# Altium schematic sheet pcb up.SchDoc
size A2
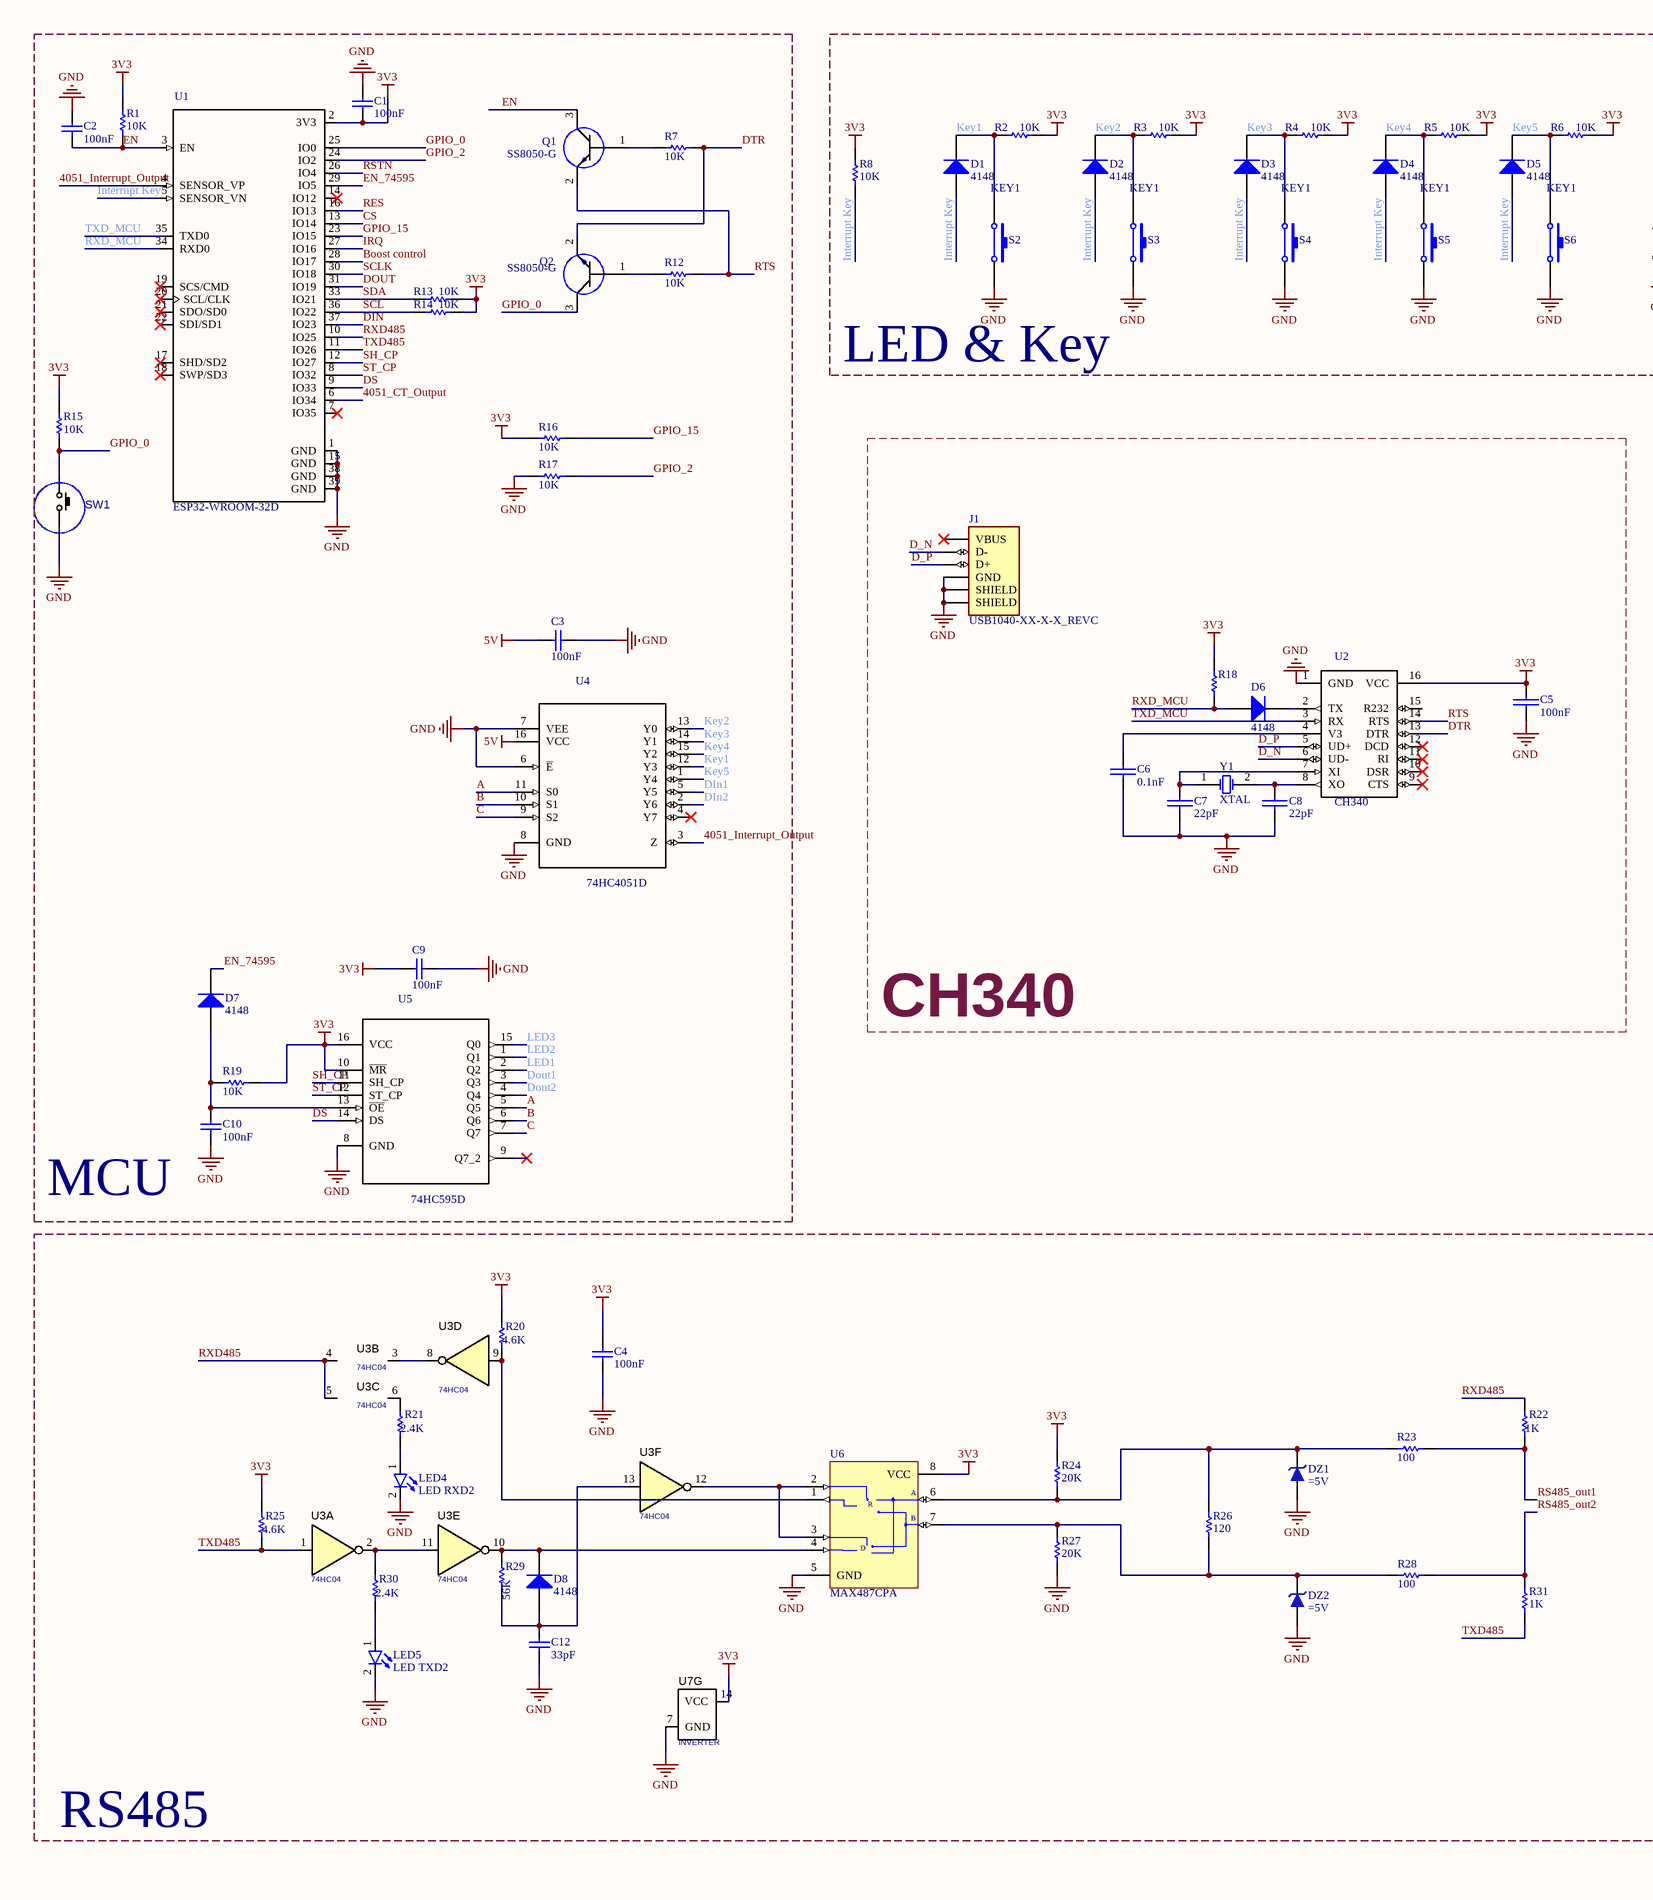
[diagram p0: pcb up.SchDoc, left]
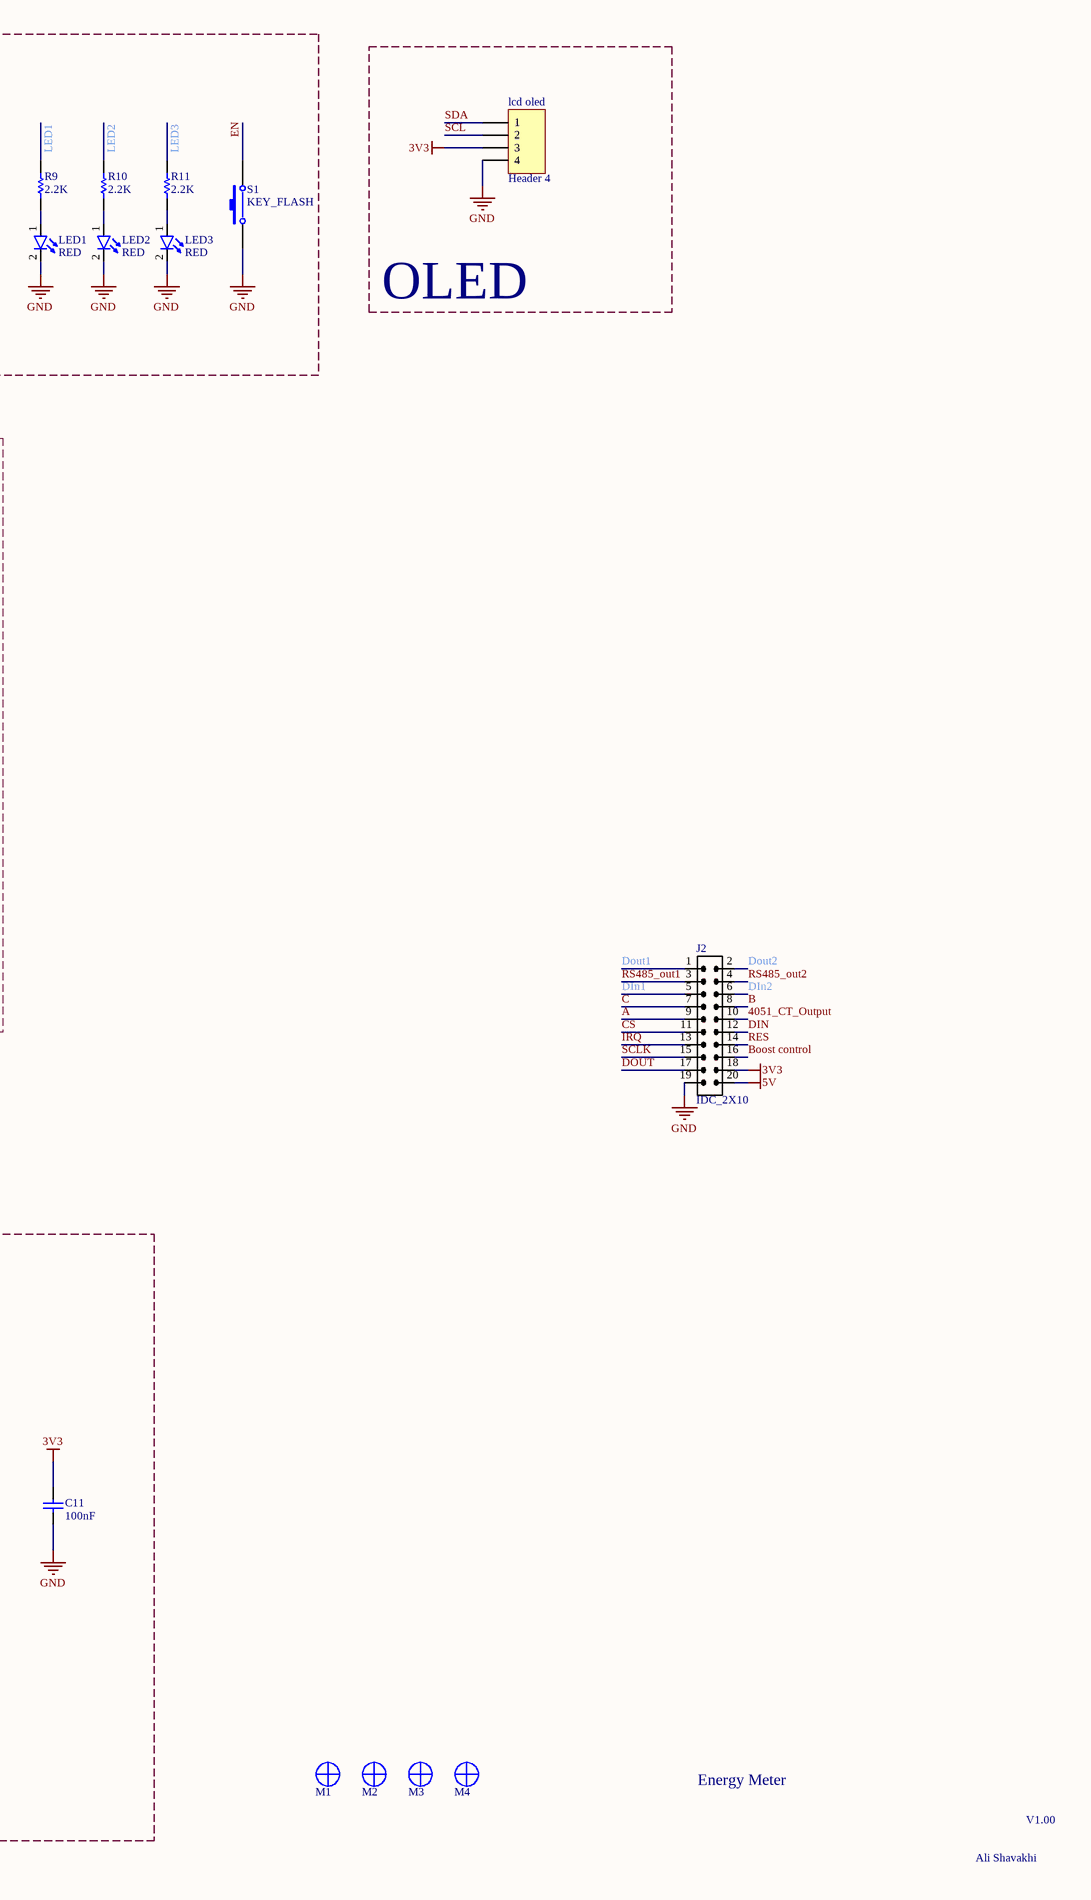
[diagram p1: pcb up.SchDoc, right]

## Parts
C1  100nF  [CAP805]
C2  100nF  [CAP805]
C3  100nF  [CAP805]
C4  100nF  [CAP805]
C5  100nF  [CAP805]
C6  0.1nF  [CAP805]
C7  22pF  [CAP805]
C8  22pF  [CAP805]
C9  100nF  [CAP805]
C10  100nF  [CAP805]
C11  100nF  [CAP805]
C12  33pF  [CAP805]
D1  4148  [Diode 1n4148 SMD]
D2  4148  [Diode 1n4148 SMD]
D3  4148  [Diode 1n4148 SMD]
D4  4148  [Diode 1n4148 SMD]
D5  4148  [Diode 1n4148 SMD]
D6  4148  [Diode 1n4148 SMD]
D7  4148  [Diode 1n4148 SMD]
D8  4148  [Diode 1n4148 SMD]
DZ1  (no value)  [SOD80, LL-34]
DZ2  (no value)  [SOD80, LL-34]
J1  USB1040-XX-X-X_REVC  [GCT_USB1040-XX-X-X_REVC]
J2  IDC_2X10  [IDC_2X10]
lcd_oled  Header 4  [HDR1X4]
LED1  RED  [LED3mm_GRN]
LED2  RED  [LED3mm_GRN]
LED3  RED  [LED3mm_GRN]
LED4  LED RXD2  [LED_SMD_0805]
LED5  LED TXD2  [LED_SMD_0805]
M1  Screw  [Board Screw]  (value not drawn)
M2  Screw  [Board Screw]  (value not drawn)
M3  Screw  [Board Screw]  (value not drawn)
M4  Screw  [Board Screw]  (value not drawn)
Q1  SS8050-G  [SOT23_BEC_M]
Q2  SS8050-G  [SOT23_BEC_M]
R1  10K  [RES0805_(2012X06L)]
R2  10K  [RES0805_(2012X06L)]
R3  10K  [RES0805_(2012X06L)]
R4  10K  [RES0805_(2012X06L)]
R5  10K  [RES0805_(2012X06L)]
R6  10K  [RES0805_(2012X06L)]
R7  10K  [RES0805_(2012X06L)]
R8  10K  [RES0805_(2012X06L)]
R9  2.2K  [RES0805_(2012X06L)]
R10  2.2K  [RES0805_(2012X06L)]
R11  2.2K  [RES0805_(2012X06L)]
R12  10K  [RES0805_(2012X06L)]
R13  10K  [RES0805_(2012X06L)]
R14  10K  [RES0805_(2012X06L)]
R15  10K  [RES0805_(2012X06L)]
R16  10K  [RES0805_(2012X06L)]
R17  10K  [RES0805_(2012X06L)]
R18  (no value)  [RES0805_(2012X06L)]
R19  10K  [RES0805_(2012X06L)]
R20  4.6K  [RES0805_(2012X06L)]
R21  2.4K  [RES0805_(2012X06L)]
R22  1K  [RES0805_(2012X06L)]
R23  100  [RES0805_(2012X06L)]
R24  20K  [RES0805_(2012X06L)]
R25  4.6K  [RES0805_(2012X06L)]
R26  120  [RES0805_(2012X06L)]
R27  20K  [RES0805_(2012X06L)]
R28  100  [RES0805_(2012X06L)]
R29  56K  [RES0805_(2012X06L)]
R30  2.4K  [RES0805_(2012X06L)]
R31  1K  [RES0805_(2012X06L)]
S1  KEY_FLASH  [SW-PB]
S2  KEY1  [SW-PB]
S3  KEY1  [SW-PB]
S4  KEY1  [SW-PB]
S5  KEY1  [SW-PB]
S6  KEY1  [SW-PB]
SW1  PUSHBUTTON  [SWPBS_SPST_6X3X5]  (value not drawn)
U1  ESP32-WROOM-32D  [ESP32_WROOM]
U2  CH340  [SO016]
U3  74HC04  [SOIC127P600X175-14N]  (parts A,B,C,D,E,F of 7)
U4  74HC4051D  [SOIC127P600X175-16N]
U5  74HC595D  [SOIC127P600X175-16N]
U6  MAX487CPA  [SO_8]
U7  INVERTER  [SOIC127P600X175-14N]  (part G of 7)
Y1  XTAL  [Crystal SMD]

## Nets
3V3: C1.1 C4.1 C5.2(-) C9.1 C11.1 J2.18 lcd_oled.3 R1.2 R2.1 R3.1 R4.1 R5.1 R6.1 R8.2 R13.1 R14.2 R15.2 R16.2 R18.1 R19.1 R20.1 R24.2 R25.1 U1.2(3V3) U2.16(VCC) U5.10(~{MR}) U5.16(VCC) U6.8(VCC) U7.14(VCC)
5V: C3.1 J2.20 U4.16(VCC)
GND: C1.2 C2.2 C3.2 C4.2 C5.1(+) C6.1(+) C7.1(+) C8.1(+) C9.2 C10.1 C11.2 C12.2 DZ1.1 DZ2.1 J1.4(GND) J1.5(SHIELD) J1.6(SHIELD) J2.19 lcd_oled.4 LED1.2(K) LED2.2(K) LED3.2(K) LED4.2(K) LED5.2(K) R17.2 R27.1 S1.1 S2.2 S3.2 S4.2 S5.2 S6.2 SW1.2(P3) U1.1(GND) U1.15(GND) U1.38(GND) U1.39(GND) U2.1(GND) U4.6(~{E}) U4.7(VEE) U4.8(GND) U5.8(GND) U6.5(GND) U7.7(GND)
4051_CT_Output: J2.10 U1.6(IO34)
4051_Interrupt_Output: U1.4(SENSOR_VP) U4.3(Z)
A: J2.9 U4.11(S0) U5.5(Q5)
B: J2.8 U4.10(S1) U5.6(Q6)
Boost control: J2.16 U1.28(IO17)
C: J2.7 U4.9(S2) U5.7(Q7)
CS: J2.11 U1.13(IO14)
D_N: J1.2(D-) U2.6(UD-)
D_P: J1.3(D+) U2.5(UD+)
DIN: J2.12 U1.37(IO23)
DIn1: J2.5 U4.5(Y5)
DIn2: J2.6 U4.2(Y6)
DOUT: J2.17 U1.31(IO19)
Dout1: J2.1 U5.3(Q3)
Dout2: J2.2 U5.4(Q4)
DS: U1.9(IO33) U5.14(DS)
DTR: Q2.2(E) R7.1 U2.13(DTR)
EN: C2.1 Q1.3(C) R1.1 S1.2 U1.3(EN)
EN_74595: D7.2(K) U1.29(IO5)
GPIO_0: Q2.3(C) R15.1 SW1.1(P1) U1.25(IO0)
GPIO_2: R17.1 U1.24(IO2)
GPIO_15: R16.1 U1.23(IO15)
Interrupt Key: D1.1(A) D2.1(A) D3.1(A) D4.1(A) D5.1(A) R8.1 U1.5(SENSOR_VN)
IRQ: J2.13 U1.27(IO16)
Key1: D1.2(K) R2.2 S2.1 U4.12(Y3)
Key2: D2.2(K) R3.2 S3.1 U4.13(Y0)
Key3: D3.2(K) R4.2 S4.1 U4.14(Y1)
Key4: D4.2(K) R5.2 S5.1 U4.15(Y2)
Key5: D5.2(K) R6.2 S6.1 U4.1(Y4)
LED1: R9.2 U5.2(Q2)
LED2: R10.2 U5.1(Q1)
LED3: R11.2 U5.15(Q0)
RES: J2.14 U1.16(IO13)
RS485_out1: J2.3 R22.1 R23.1
RS485_out2: J2.4 R28.1 R31.2
RSTN: U1.26(IO4)
RTS: Q1.2(E) R12.1 U2.14(RTS)
RXD485: R22.2 U1.10(IO25) U3.4(2Y) U3.5(3A)
RXD_MCU: D6.1(A) R18.2 U1.34(RXD0)
SCL: lcd_oled.2 R14.1 U1.36(IO22)
SCLK: J2.15 U1.30(IO18)
SDA: lcd_oled.1 R13.2 U1.33(IO21)
SH_CP: U1.12(IO27) U5.11(SH_CP)
ST_CP: U1.8(IO32) U5.12(ST_CP)
TXD485: R25.2 R31.1 U1.11(IO26) U3.1(1A)
TXD_MCU: U1.35(TXD0) U2.3(RX)
NetC6_2: C6.2(-) U2.4(V3)
NetC7_2: C7.2(-) U2.7(XI) Y1.1(OSC1)
NetC8_2: C8.2(-) U2.8(XO) Y1.2(OSC2)
NetC10_2: C10.2 D7.1(A) R19.2 U5.13(~{OE})
NetC12_1: C12.1 D8.1(A) R29.2 U3.13(6A)
NetD6_2: D6.2(K) U2.2(TX)
NetD8_2: D8.2(K) R29.1 U3.10(5Y) U6.4(DI)
NetDZ1_2: DZ1.2 R23.2 R24.1 R26.2 U6.6(A)
NetDZ2_2: DZ2.2 R26.1 R27.2 R28.2 U6.7(B)
NetLED1_1: LED1.1(A) R9.1
NetLED2_1: LED2.1(A) R10.1
NetLED3_1: LED3.1(A) R11.1
NetLED4_1: LED4.1(A) R21.2
NetLED5_1: LED5.1(A) R30.2
NetQ1_1: Q1.1(B) R7.2
NetQ2_1: Q2.1(B) R12.2
NetR20_2: R20.2 U3.9(4A) U6.1(RO)
NetR21_1: R21.1 U3.6(3Y)
NetR30_1: R30.1 U3.2(1Y) U3.11(5A)
NetU3_3: U3.3(2A) U3.8(4Y)
NetU3_12: U3.12(6Y) U6.2(~{RE}) U6.3(DE)

Not connected (* = marked no-connect by the designer): J1 1(VBUS)*; U1 7(IO35)* 14(IO12)* 17(SHD/SD2)* 18(SWP/SD3)* 19(SCS/CMD)* 20(SCL/CLK)* 21(SDO/SD0)* 22(SDI/SD1)*; U2 9(CTS)* 10(DSR)* 11(RI)* 12(DCD)* 15(R232); U4 4(Y7)*; U5 9(Q7_2)*

## Notes on the sheet
- OLED
- LED & Key
- CH340
- MCU
- Energy Meter
- RS485
- Ali Shavakhi
- V1.00
- (in symbol MAX487CPA) R; D

## Library data of the parts
C1-C4 C9-C11 = CAP SMD PACKAGE: TOTAL CAPACITOR SMD PACK; Designer: Abbas Basereh; Desc.: CAP SMD TOTAL PACKAGES; Data: 2017-3-10; VALUE: 100nF
C5-C8 = Cap-Bipolar: Bipolar Capacitor; Voltage: 100V; Designer: Saeid Jorablo; Organazation: ControTec; Adding Date: 1387/12/20
  C5: Value: 100nF
  C6: Value: 0.1nF
  C7 C8: Value: 22pF
C12 = CAP SMD PACKAGE: TOTAL CAPACITOR SMD PACK; Designer: Abbas Basereh; Desc.: CAP SMD TOTAL PACKAGES; VALUE: 100nF; Data: 2017-3-10
D1-D8 = Diode: Default Diode; Published: 8-Jun-2000; LatestRevisionDate: 17-Jul-2002; LatestRevisionNote: Re-released for DXP Platform.; PackageVersion: Sep-1996; PackageReference: SMC; Publisher: Altium Limited; PackageDescription: DO-214-AB/SMC; 2 C-Bend Leads; Body 7.9 x 5.9 mm, inc. leads (LxW); Code_JEDEC: DO-214-AB
DZ1 DZ2 = ZENER GENERAL DIODE: DIODE ZENER GENERAL; VALUE: 12V; Published: 2017-1-12; PackageVersion: 2017-1-12; PackageReference: DO 35; Publisher: Abbas Basereh; PackageDescription: DIODE GEN ZENER; ComponentLink1Description: Manufacturer Link; ComponentLink2Description: Datasheet
J1 = USB1040-XX-X-X_REVC: USB-A _USB TYPE-A_ USB 2.0 Receptacle Connector 4 Position Through Hole; MP: USB1040-GF-L-B; MF: Global Connector Technology; Value: *; SnapEDA_Link: https://www.snapeda.com/parts/USB1040-GF-L-B/Global%20Connector%20Technology/view-part/812880/?ref=snap; Availability: Unavailable; Package: None; Price: None
J2 = IDC_2X10: CONN, IDC, Male, pitch: 2.54mm, 20POS; VALUE: IDC_2X10
lcd_oled = Header 4: Header, 4-Pin; LatestRevisionDate: 17-Jul-2002; LatestRevisionNote: Re-released for DXP Platform.; Publisher: Altium Limited
LED1-LED5 = LED: Designer: Saeid Jorablo; Organazation: ControTec; Adding Date: 1387/12/22; Size: SMD 1206
  LED1-LED3: Color: RED
  LED4: Color: LED RXD2
  LED5: Color: LED TXD2
M1-M4 = Board Screw 3MM: Board Screw With Spacer
Q1 Q2 = SS8050-G: Bipolar _BJT_ Transistor NPN 25V 1.5A 100MHz 300mW Surface Mount SOT-23; MF: Comchip Technology; Package: TO-236 Comchip; Price: None; MP: SS8050-G; Availability: Unavailable; SnapEDA_Link: https://www.snapeda.com/parts/SS8050-G/Comchip%20Technology/view-part/809142/?ref=snap; Value: *
R1-R8 R12-R17 R19-R31 = RES SMD PACKAGE: TOTAL SMD RESISTOR PACK; Designer: Abbas Basereh; Desc.: RES SMD PAKAGES; Data: 2017-3-10
R9-R11 R18 = RES SMD PACKAGE: TOTAL SMD RESISTOR PACK(1206); Designer: Abbas Basereh; Desc.: RES SMD PAKAGES; Data: 2017-3-10
S1-S6 = PB-2pin: Switch; E-mail: picpars@gmail.com; Designer: Seyed Mohsen Ghasemian; Publisher: www.picpars.com; WEB: www.picpars.com
SW1 = SWPBS_SPST_6X3_222BMVBAR: SWITCH, PUSH BUTTON, TACTILE, SMD, SPST, 6X3.5X5mm; MANF: CTS; DESC: DESCRIPTION; VALUE: PUSHBUTTON; ASSEMBLY: ASSEMBLY; PARAM: PARAM; PRICE: PRICE; MANF_P#: 222BMVBAR
U1 = ESP32-WROOM-32D: IC: SoC; GPIO, I2C, I2S, IR, SD, SDIO, SPI, UART; 2.7÷3.6VDC; 20dBm; MF: Espressif Systems; SnapEDA_Link: https://www.snapeda.com/parts/ESP32-WROOM-32D/Espressif%20Systems/view-part/?ref=snap; Price: None; MP: ESP32-WROOM-32D; Availability: Unavailable; Package: Module Espressif Systems; Value: *
U2 = CH340: MF: Seeed Technology; Availability: Unavailable; Price: None; Package: None; SnapEDA_Link: https://www.snapeda.com/parts/CH340/Seeed%20Technology%20Co.%2C%20Ltd/view-part/?ref=snap; MP: CH340; Value: *
U3 U7 = NOTx6_SN74HC04: Inverter IC Logic-level 6 section SOP-14 SMD; MANF: Texas Instruments; MANF_P#: SN74HC04NSR; PARAM2: 2 V ~ 6 V; PARAM: 5.2mA, 5.2mA
  U3: VALUE: 74HC04
  U7: VALUE: INVERTER
U4 = 74HC4051D: Single 8-Channel Analog Multiplexer/Demultiplexer, VCC=2 to 6V, PD=500mW, tpd/tpz=15ns_typ._; MF: Toshiba Semiconductor; SnapEDA_Link: https://www.snapeda.com/parts/74HC4051D/Toshiba%20Semiconductor%20and%20Storage/view-part/?ref=snap; MP: 74HC4051D; Availability: Unavailable; Package: SOIC-16 Toshiba; Price: None; Value: *
U5 = 74HC595D: Shift Register Single 8-Bit Serial to Serial/Parallel 16-Pin SO; MF: Toshiba Semiconductor; Availability: Good; SnapEDA_Link: https://www.snapeda.com/parts/74HC595D/Toshiba%20Semiconductor%20and%20Storage/view-part/?ref=snap; Price: 0.21 USD; Package: SO-16 NXP Semiconductors; MP: 74HC595D; Value: *
U6 = MAX487CPA: Low-Power, Slew-Rate-Limited RS-485/RS-422 Transceiver; Published: 16-Jan-2001; LatestRevisionDate: 29-May-2009; LatestRevisionNote: Component Body Added.; DatasheetVersion: Feb-1996; PackageVersion: RevB, 21-0043; PackageReference: PA8; Publisher: Altium Limited; PackageDescription: DIP, 8-Pin, Row Spacing 7.62 mm, Pitch 2.54 mm; Code_JEDEC: MS-001-AB; ComponentLink1Description: Manufacturer Link; ComponentLink1URL: http://www.maxim-ic.com/; ComponentLink2Description: Datasheet; ComponentLink2URL: http://pdfserv.maxim-ic.com/en/ds/MAX1487-MAX491.pdf
Y1 = XTAL: Crystal Oscillator; Published: 8-Jun-2000; LatestRevisionDate: 17-Jul-2002; LatestRevisionNote: Re-released for DXP Platform.; PackageReference: R38; Publisher: Altium Limited; PackageDescription: Crystal, Thru-Hole; 2 Leads; Body 3.1 x 8.2 mm (Dia.xH)